# Altium schematic sheet Analogue_IN.SchDoc
size A4; SheetNumber: 2; SheetTotal: 8; SPICEModelCacheHWMVXXES: <root> / <DocumentId>HWMVXXES</DocumentId> / <CacheFrame Number="0"> / <Model Name="mcp6001" Kind="CKT"> / <Text>.SUBCKT MCP6001 1 2 3 4 5 / *               | | | | | / *               | | | | Output / *               | | | Negative Supply / *               | | Positive Supply / *               | Inverting Input / *               Non-inverting Input / * / ******************************************************************************** / * Software License Agreement                                                   * / *                                                                              * / * The software supplied herewith by Microchip Technology Incorporated (the     * / * "Company") is intended and supplied to you, the Company's customer, for use  * / * soley and exclusively on Microchip products.                                 * / *                                                                              * / * The software is owned by the Company and/or its supplier, and is protected   * / * under applicable copyright laws. All rights are reserved. Any use in         * / * violation of the foregoing restrictions may subject the user to criminal     * / * sanctions under applicable laws, as well as to civil liability for the       * / * breach of the terms and conditions of this license.                          * / *                                                                              * / * THIS SOFTWARE IS PROVIDED IN AN "AS IS" CONDITION. NO WARRANTIES, WHETHER    * / * EXPRESS, IMPLIED OR STATUTORY, INCLUDING, BUT NOT LIMITED TO, IMPLIED        * / * WARRANTIES OF MERCHANTABILITY AND FITNESS FOR A PARTICULAR PURPOSE APPLY TO  * / * THIS SOFTWARE. THE COMPANY SHALL NOT, IN ANY CIRCUMSTANCES, BE LIABLE FOR    * / * SPECIAL, INCIDENTAL OR CONSEQUENTIAL DAMAGES, FOR ANY REASON WHATSOEVER.     * / ******************************************************************************** / * / * Macromodel for the MCP6001/2/4 op amp family: / *   MCP6001, MCP6001R, MCP6001U, MCP6002, MCP6004 / * / * Revision History: / *   REV A: 21-Jun-02, Created model / *   REV B: 16-Jul-02, Improved output stage / *   REV C: 03-Jan-03, Added MCP6001 / *   REV D: 19-Aug-06, Added over temperature, improved output stage, / *                     fixed overdrive recovery time / *   REV E: 27-Jul-07, Updated output impedance for better model stability w/cap load / *   REV F: 09-Jul-12, Added MCP6001R, MCP6001U / * / * Recommendations: / *   Use PSPICE (other simulators may require translation) / *   For a quick, effective design, use a combination of: data sheet / *     specs, bench testing, and simulations with this macromodel / *   For high impedance circuits, set GMIN=100F in .OPTIONS / * / * Supported: / *   Typical performance for temperature range (-40 to 125) degrees Celsius / *   DC, AC, Transient, and Noise analyses. / *   Most specs, including: offsets, DC PSRR, DC CMRR, input impedance, / *     open loop gain, voltage ranges, supply current, ... , etc. / *   Temperature effects for Ibias, Iquiescent, Iout short circuit / *   current, Vsat on both rails, Slew Rate vs. Temp and P.S. / * / * Not Supported: / *   Some Variation in specs vs. Power Supply Voltage / *   Monte Carlo (Vos, Ib), Process variation / *   Distortion (detailed non-linear behavior) / *   Behavior outside normal operating region / * / * Input Stage / V10  3 10 -500M / R10 10 11 6.90K / R11 10 12 6.90K / C11 11 12 0.2p / C12 1  0 6.00P / E12 71 14 POLY(4) 20 0 21 0 26 0 27 0   1.00M 20.1 20.1 1 1 / G12 1 0 62 0 1m / M12 11 14 15 15 NMI L=2.00U W=42.0U / M14 12  2 15 15 NMI L=2.00U W=42.0U / G14 2 0 62 0 1m / C14  2  0 6.00P / I15 15  4 50.0U / V16 16  4 -300M / GD16 16 1 TABLE {V(16,1)} ((-100,-1p)(0,0)(1m,1n)(2m,1m)(3m,1)) / V13  3 13 -300M / GD13 2 13 TABLE {V(2,13)} ((-100,-1p)(0,0)(1m,1n)(2m,1m)(3m,1)) / R70 1 0 20.6T / R71 2 0 20.6T / R72 1 2 20T / I80 1 2 0.5p / * / * Noise, PSRR, and CMRR / I20 21 20 423U / D20 20  0 DN1 / D21  0 21 DN1 / G26  0 26 POLY(1) 3 4   110U -49U / R26 26  0 1 / G27  0 27 POLY(2) 1 0 2 0   -440U 39.7U 39.7U / R27 27  0 1 / * / * Open Loop Gain, Slew Rate / G30  0 30 POLY(1) 12 11   0 1 / R30 30  0 1K / G31  0 31 POLY(1) 3 4 86 5.25 / R31 31  0 1 TC=2.8m / GD31 30 31 TABLE {V(30,31)} ((-11,-1)(-10,-10n)(0,0)(1m,1000)) / G32 32  0 POLY(1) 3 4 113.7 3.5 / R32 32  0 1 TC=2.65m / GD32 30 32 TABLE {V(30,32)} ((-1m,-1000)(0,0)(10,10n)(11,1)) / G33 0 33 30 0 1m / R33 33 0 1k / G34  0 34 33 0 425M / R34  34 0 1K / C34  34 0 74U / G37  0 37 34 0 1m / R37  37 0 1K / C37  37 0 41.6P / G38  0 38 37 0 1m / R38  39 0 1K / L38  38 39 100U / E38  35 0 38 0 1 / G35 33 0 TABLE {V(35,3)} ((-1,-1n)(0,0)(16,1n))(16.1,1)) / G36 33 0 TABLE {V(35,4)} ((-16.1,-1)((-16,-1n)(0,0)(1,1n)) / * / * Output Stage / R80 50 0 100MEG / G50 0 50 57 96 2 / R58 57  96 0.50 / R57 57  0 750 / C58  5  0 2.00P / G57  0 57 POLY(3) 3 0 4 0 35 0   0 0.67M 0.67M 1.5M / GD55 55 57 TABLE {V(55,57)} ((-2m,-1)(-1m,-1m)(0,0)(10,1n)) / GD56 57 56 TABLE {V(57,56)} ((-2m,-1)(-1m,-1m)(0,0)(10,1n)) / E55 55  0 POLY(2) 3 0 51 0 -0.7m 1 -40.0M / E56 56  0 POLY(2) 4 0 52 0 1.2m 1 -37.0M / R51 51 0 1k / R52 52 0 1k / GD51 50 51 TABLE {V(50,51)} ((-10,-1n)(0,0)(1m,1m)(2m,1)) / GD52 50 52 TABLE {V(50,52)} ((-2m,-1)(-1m,-1m)(0,0)(10,1n)) / G53  3  0 POLY(1) 51 0  -49U 1M / G54  0  4 POLY(1) 52 0  -49U -1M / * / * Current Limit / G99 96 5 99 0 1 / R98 0 98 1 TC=-2.8M,2.63U / G97 0 98 TABLE { V(96,5) } ((-11.0,-10.0M)(-1.00M,-9.9M)(0,0)(1.00M,9.9M)(11.0,10.0M)) / E97 99 0 VALUE { V(98)*((V(3)-V(4))*359M + 310M)} / D98 4 5 DESD / D99 5 3 DESD / * / * Temperature / Voltage Sensitive IQuiscent / R61 0 61 100 TC 3.11M 4.51U / G61 3 4 61 0 1 / G60 0 61 TABLE {V(3, 4)} / + ((0,0)(900M,0.0106U)(1.00,0.20U)(1.3,0.63U) / + (1.5,0.66U)(1.6,1.06U)(5.5,1.10U)) / * / * Temp Sensitive offset voltage / I73 0 70 DC 1uA / R74 0 70 1 TC=2 / E75 1 71 70 0 1 / * / * Temp Sensistive IBias / I62 0 62 DC 1uA / R62 0 62 REXP 58.2u / * Voltage on R62 used for G12, G14 in input stage / * / * Models / .MODEL NMI NMOS / .MODEL DESD  D   N=1 IS=1.00E-15 / .MODEL DL  D   N=1 IS=1F / .MODEL DN1 D   IS=1P KF=146E-18 AF=1 / .MODEL REXP RES TCE=10.1 / .ENDS MCP6001</Text> / </Model> / </CacheFrame> / </root>
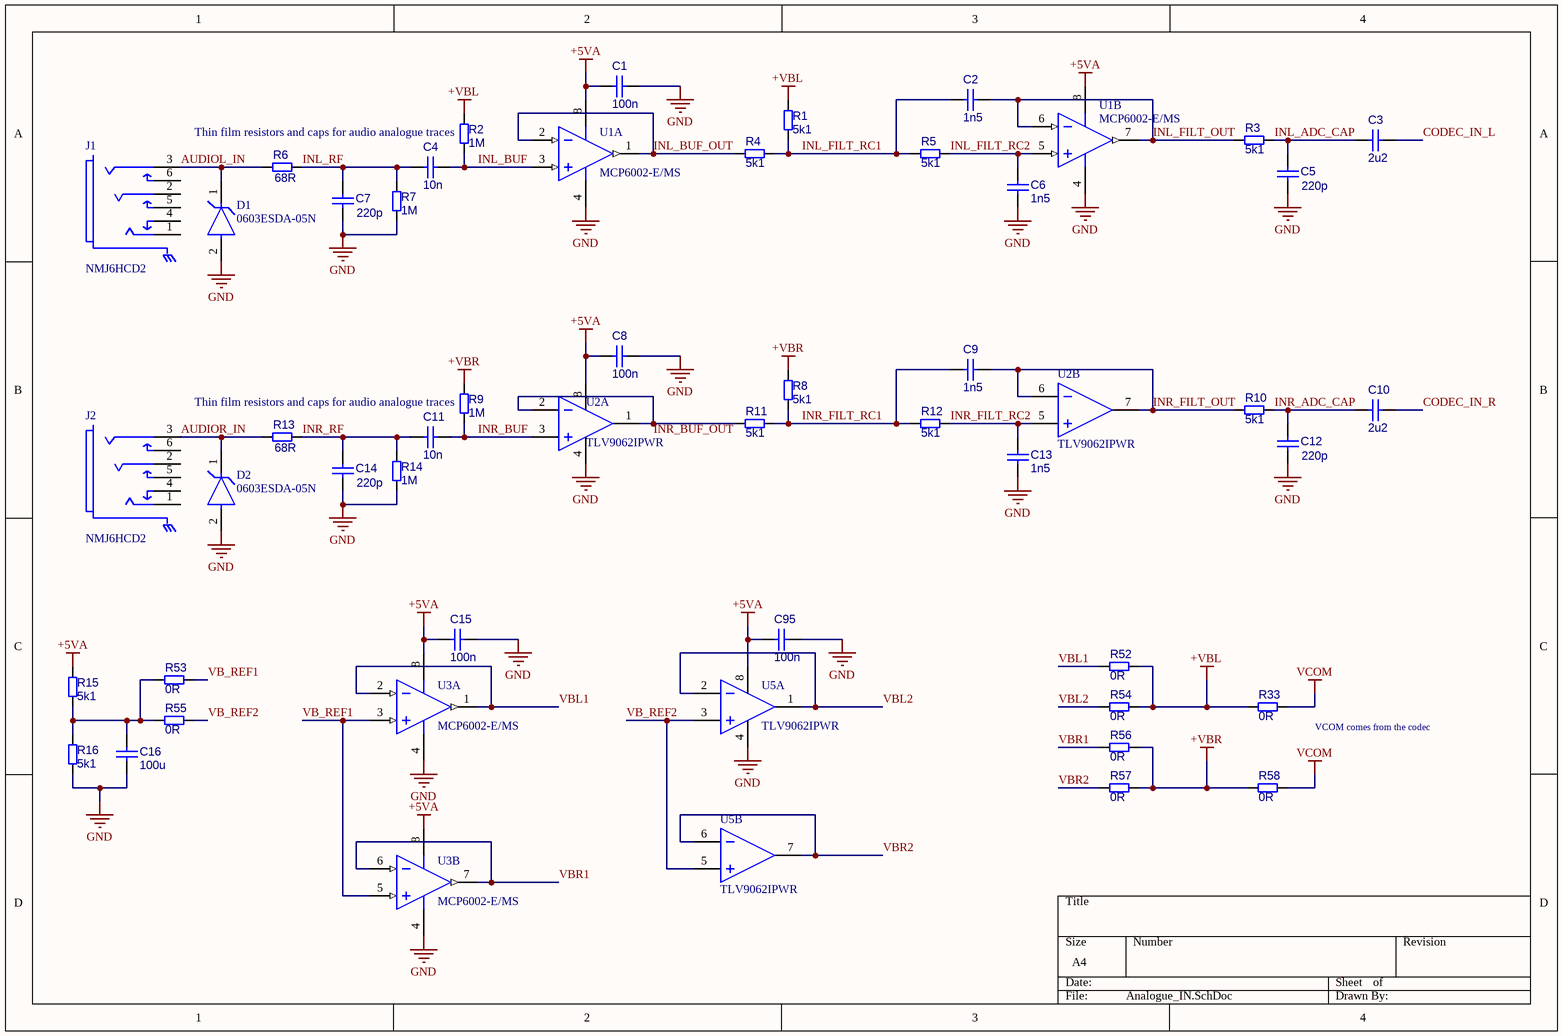
[diagram p0: Analogue_IN.SchDoc]

## Parts
C1  100n  [CAPC1005X50N_0402]
C2  1n5  [C_0402]
C3  2u2  [C_0402]
C4  10n  [C_0402]
C5  220p  [C_0402]
C6  1n5  [C_0402]
C7  220p  [C_0402]
C8  100n  [CAPC1005X50N_0402]
C9  1n5  [C_0402]
C10  2u2  [C_0402]
C11  10n  [C_0402]
C12  220p  [C_0402]
C13  1n5  [C_0402]
C14  220p  [C_0402]
C15  100n  [CAPC1005X50N_0402]
C16  100u  [C_1210]
C95  100n  [CAPC1005X50N_0402]
D1  0603ESDA-05N  [FP-1610-MFG]
D2  0603ESDA-05N  [FP-1610-MFG]
J1  NMJ6HCD2  [FP-NMJ6HCD2-MFG]
J2  NMJ6HCD2  [FP-NMJ6HCD2-MFG]
R1  5k1  [R_0603]
R2  1M  [R_0603]
R3  5k1  [R_0603]
R4  5k1  [R_0603]
R5  5k1  [R_0603]
R6  68R  [R_0603]
R7  1M  [R_0603]
R8  5k1  [R_0603]
R9  1M  [R_0603]
R10  5k1  [R_0603]
R11  5k1  [R_0603]
R12  5k1  [R_0603]
R13  68R  [R_0603]
R14  1M  [R_0603]
R15  5k1  [R_0603]
R16  5k1  [R_0603]
R33  0R  [R_0603]
R52  0R  [R_0603]
R53  0R  [R_0603]
R54  0R  [R_0603]
R55  0R  [R_0603]
R56  0R  [R_0603]
R57  0R  [R_0603]
R58  0R  [R_0603]
U1  MCP6002-E/MS  [MSOP-MS8_M]  (parts A,B of 2)
U2  TLV9062IPWR  [TSSOP-8_TLV9062IPWR]  (parts A,B of 2)
U3  MCP6002-E/MS  [MSOP-MS8_M]  (parts A,B of 2)
U5  TLV9062IPWR  [TSSOP-8_TLV9062IPWR]  (parts A,B of 2)

## Nets
+5VA: C1.1 C8.1 C15.1 C95.1 R15.2 U1.8(VDD) U2.8(-IN) U3.8(VDD) U5.8(-IN)
+VBL: R1.1 R2.2 R33.2 R52.1 R54.1
+VBR: R8.1 R9.2 R56.1 R57.1 R58.2
GND: C1.2 C5.1 C6.2 C7.1 C8.2 C12.1 C13.2 C14.1 C15.2 C16.2 C95.2 D1.2(A) D2.2(A) R7.1 R14.1 R16.1 U1.4(VSS) U2.4(-IN) U3.4(VSS) U5.4(-IN)
VCOM: R33.1 R58.1
AUDIOL_IN: D1.1(C) J1.3(S) R6.1
AUDIOR_IN: D2.1(C) J2.3(S) R13.1
CODEC_IN_L: C3.1
CODEC_IN_R: C10.1
INL_ADC_CAP: C3.2 C5.2 R3.1
INL_BUF: C4.1 R2.1 U1.3(VINA+)
INL_BUF_OUT: R4.2 U1.1(VOUTA) U1.2(VINA-)
INL_FILT_OUT: C2.1 R3.2 U1.6(VINB-) U1.7(VOUTB)
INL_FILT_RC1: C2.2 R1.2 R4.1 R5.1
INL_FILT_RC2: C6.1 R5.2 U1.5(VINB+)
INL_RF: C4.2 C7.2 R6.2 R7.2
INR_ADC_CAP: C10.2 C12.2 R10.1
INR_BUF: C11.1 R9.1 U2.3(OUT)
INR_FILT_OUT: C9.1 R10.2 U2.6(+IN) U2.7(-IN)
INR_FILT_RC1: C9.2 R8.2 R11.1 R12.1
INR_FILT_RC2: C13.1 R12.2 U2.5(OUT)
INR_RF: C11.2 C14.2 R13.2 R14.2
VB_REF1: R53.1 U3.3(VINA+) U3.5(VINB+)
VB_REF2: R55.1 U5.3(OUT) U5.5(OUT)
VBL1: R52.2 U3.1(VOUTA) U3.2(VINA-)
VBL2: R54.2 U5.1(-IN) U5.2(+IN)
VBR1: R56.2 U3.6(VINB-) U3.7(VOUTB)
VBR2: R57.2 U5.6(+IN) U5.7(-IN)
NetC16_1: C16.1 R15.1 R16.2 R53.2 R55.2
NetR11_2: R11.2 U2.1(-IN) U2.2(+IN)

Not connected (* = marked no-connect by the designer): J1 1(T) 2(R) 4(TN) 5(RN) 6(SN); J2 1(T) 2(R) 4(TN) 5(RN) 6(SN)

## Notes on the sheet
- (near R2) Thin film resistors and caps for audio analogue traces
- (near R9) Thin film resistors and caps for audio analogue traces
- (near R33) VCOM comes from the codec
- Labels drawn without touching a wire or pin: INR_BUF_OUT

## Library data of the parts
C1 C8 C15 C95 = CMP-001-00084-2: MLCC 0402 50V / Samsung CL05B104KB54PNC
C2 C6 C9 C13 = CMP-001-00085-2: MLCC 0603 50V / Samsung CL10C152JB8NNNC
C3 C10 = CMP-001-00085-2: Capacitor SMD Tantalum 0603 50V / Kyocera AVX F981C225MMA
C4 C11 = CMP-001-00085-2: MLCC 0603 50V / TDK C1608C0G1H103JT000N
C5 C7 C12 C14 = CMP-001-00085-2: MLCC 0603 50V / Samsung CL10C221JB8NNNC
C16 = CMP-001-00088-1: MLCC 1210 10V / Samsung CL32A107MQVNNNE
D1 D2 = CMP-12225-000013-1: BORN 0603ESDA-05N Diode TVS / ESD Bidirectional 0603; Manufacturer: STMicroelectronics; Manufacturer Part Number: ESDA7P60-1U1M; Number Of Channels: 1; Standoff Height: 0mm; Breakdown Voltage: 6.4V; Direction: Unidirectional; Clamping Voltage: 10.2V; Peak Pulse Power: 700W; Peak Pulse Current: 60A; Reverse Standoff Voltage: 5V; Max Junction Temp: +150°C; ComponentLink2Description: Datasheet; Temperature Range Low: -55°C; Package: 1610; Lead Free: Yes; Temperature Range High: +150°C; Temperature: -55°C to +150°C; Device Class L2: TVS Diodes; Category: Diode; Device Class L1: Circuit Protection; Digikey Description: TVS DIODE 5V 11.6V 1610; ComponentLink2URL: http://www.st.com/content/ccc/resource/technical/document/datasheet/44/e9/26/44/42/ee/4f/e5/DM00139972.pdf/files/DM00139972.pdf/jcr:content/translations/en.DM00139972.pdf; RoHS: TRUE; Octopart: https://octopart.com/esda7p60-1u1m-stmicroelectronics-52112702; Height: 0.65mm; Device Class L3: unset; Automotive: No
J1 J2 = CMP-78736-000004-1: Conn 1/4" Stereo Jack F 2 POS Solder ST Thru-Hole 6 Terminal 1 Port; Number of Ports: 1; Max Current Rating: 3A; Number of Contacts: 2; Number of Terminals/Pins: 6; Gender: Female; Voltage Rating: 50V; Contact Plating: Silver; Mount: Through Hole; RoHS Compliant: Yes; Series: M; Orientation: Horizontal; Number of Pins: 6; Weight: 0.282192oz; Housing Material: Polyamide; Depth: 18.2mm; Max Operating Temperature: 70°C; Termination: Through Hole; Color: Black; Min Operating Temperature: -25°C; Contact Material: Chrome; Package Quantity: 200
R1 R3-R5 R8 R10-R12 R15 R16 = CMP-009-00177-7: Chip THIN FILM 0603 / Viking Tech ARG03FTC5101
R2 R7 R9 R14 = CMP-009-00177-7: Chip THIN FILM 0603 / Viking Tech AR03FTC1004
R6 R13 = CMP-009-00177-7: Chip THIN FILM 0603 / Resistor.Today HPCR0603F68R0K9
R33 R52-R58 = CMP-009-00177-7: Chip 0603
U1 U3 = CMP-0187-00576-3: None; Nominal Supply Current: 100uA; Max Supply Voltage: 6V; Amplifier Type: GENERAL PURPOSE; Output Current: 23mA; Gain Bandwidth Product: 1MHz; Number of Channels: 2; Power Supply Rejection Ratio (PSRR): 86dB; Min Supply Voltage: 1.8V; Input Bias Current: 1pA; Input Offset Voltage (Vos): 4.5mV; Operating Supply Voltage: 5.5V; Slew Rate-Nom: 0.6V/µs; Common Mode Rejection Ratio: 60dB; Voltage Gain: 112dB; Mount: Surface Mount; Case/Package: MSOP; Lead Free: Lead Free; Width: 3mm; Radiation Hardening: No; Technology: CMOS; Number of Pins: 8; Supply Current: 100uA; Height: 0.95mm; Number of Elements: 2; Min Operating Temperature: -40°C; Package Quantity: 100; Packaging: Rail/Tube; Max Operating Temperature: 125°C; Slew Rate: 0.6V/µs; RoHS Compliant: Yes; Input Offset Voltage-Max: 4.5mV; Number of Amplifiers: 2; Length: 3mm; Unity Gain Bandwidth Product: 1MHz; REACH SVHC: No SVHC; Bandwidth: 1MHz; Number of Circuits: 2
U2 U5 = CMP-014-00002-2: Dual, 5.5-V, 10-MHz operational amplifier 8-TSSOP -40 to 125; Manufacturer Lifecycle Status: ACTIVE; Bandwidth: 10MHz; Number of Channels: 2; Slew Rate: 6.5V/µs; Length: 3mm; Max Operating Temperature: 125°C; RoHS: Compliant; Height: 1.2mm; Case/Package: TSSOP; Pins: 8; Width: 4.4mm; Min Operating Temperature: -40°C; Thickness: 1mm; Lifecycle Status: Production; PartId: 1